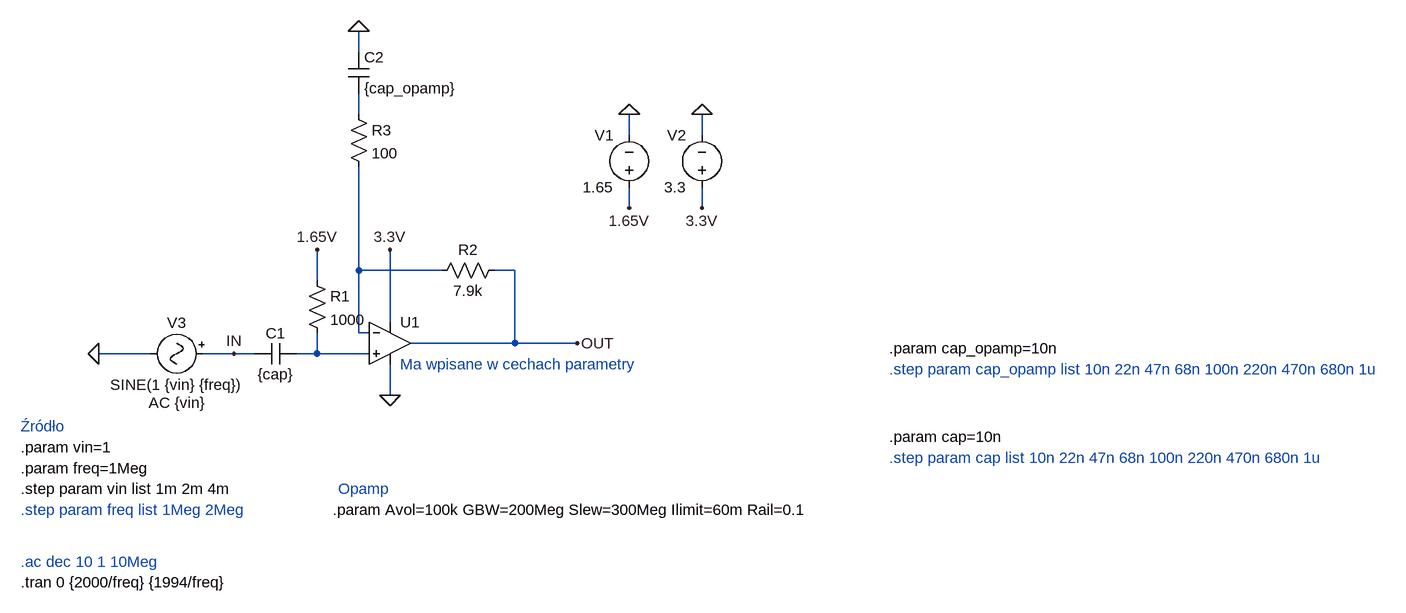
[diagram p0: schematic wzm_wej.asc]
wzm_wej.asc, the LTspice schematic file:
Version 4.1
SHEET 1 1884 680
WIRE 240 -304 240 -336
WIRE 240 -208 240 -240
WIRE 656 -176 656 -208
WIRE 768 -176 768 -208
WIRE 656 -64 656 -96
WIRE 768 -64 768 -96
WIRE 240 32 240 -128
WIRE 368 32 240 32
WIRE 480 32 448 32
WIRE 176 48 176 0
WIRE 288 112 288 0
WIRE 240 128 240 32
WIRE 256 128 240 128
WIRE 480 144 480 32
WIRE 480 144 320 144
WIRE 576 144 480 144
WIRE -80 160 -160 160
WIRE 48 160 0 160
WIRE 80 160 48 160
WIRE 176 160 176 128
WIRE 176 160 144 160
WIRE 256 160 176 160
WIRE 288 224 288 176
FLAG 656 -208 0
FLAG 768 -208 0
FLAG -160 160 0
FLAG 288 224 0
FLAG 240 -336 0
FLAG 576 144 OUT
FLAG 656 -64 1.65V
FLAG 176 0 1.65V
FLAG 768 -64 3.3V
FLAG 288 0 3.3V
FLAG 48 160 IN
SYMBOL cap 144 144 R90
WINDOW 0 0 32 VBottom 2
WINDOW 3 32 32 VTop 2
SYMATTR InstName C1
SYMATTR Value {cap}
SYMBOL res 160 32 R0
SYMATTR InstName R1
SYMATTR Value 1000
SYMBOL voltage 656 -80 R180
WINDOW 0 24 96 Left 2
WINDOW 3 24 16 Left 2
WINDOW 123 0 0 Left 0
WINDOW 39 0 0 Left 0
SYMATTR InstName V1
SYMATTR Value 1.65
SYMBOL voltage 768 -80 R180
WINDOW 0 24 96 Left 2
WINDOW 3 24 16 Left 2
WINDOW 123 0 0 Left 0
WINDOW 39 0 0 Left 0
SYMATTR InstName V2
SYMATTR Value 3.3
SYMBOL Misc\\signal 16 160 R90
WINDOW 0 -32 56 VBottom 2
WINDOW 3 32 56 VTop 2
WINDOW 123 60 56 VTop 2
WINDOW 39 0 0 Left 0
SYMATTR InstName V3
SYMATTR Value SINE(1 {vin} {freq})
SYMATTR Value2 AC {vin}
SYMBOL res 464 16 R90
WINDOW 0 0 56 VBottom 2
WINDOW 3 32 56 VTop 2
SYMATTR InstName R2
SYMATTR Value 7.9k
SYMBOL res 224 -224 R0
SYMATTR InstName R3
SYMATTR Value 100
SYMBOL cap 224 -304 R0
SYMATTR InstName C2
SYMATTR Value {cap_opamp}
SYMBOL OpAmps\\UniversalOpAmp2 288 144 R0
SYMATTR InstName U1
SYMATTR Value2 Avol={Avol} GBW={GBW} Slew={Slew}
SYMATTR SpiceLine Ilimit={Ilimit} Rail={Rail} Vos=0
TEXT -280 368 Left 2 !.step param vin list 1m 2m 4m
TEXT -280 400 Left 2 ;.step param freq list 1Meg 2Meg
TEXT -280 480 Left 2 ;.ac dec 10 1 10Meg
TEXT -280 512 Left 2 !.tran 0 {2000/freq} {1994/freq}
TEXT 200 400 Left 2 !.param Avol=100k GBW=200Meg Slew=300Meg Ilimit=60m Rail=0.1
TEXT -280 272 Left 2 ;Źródło
TEXT 208 368 Left 2 ;Opamp
TEXT -280 304 Left 2 !.param vin=1
TEXT -280 336 Left 2 !.param freq=1Meg
TEXT 304 176 Left 2 ;Ma wpisane w cechach parametry
TEXT 1056 288 Left 2 !.param cap=10n
TEXT 1056 320 Left 2 ;.step param cap list 10n 22n 47n 68n 100n 220n 470n 680n 1u
TEXT 1056 152 Left 2 !.param cap_opamp=10n
TEXT 1056 184 Left 2 ;.step param cap_opamp list 10n 22n 47n 68n 100n 220n 470n 680n 1u

The netlist it stands for:
* wzm_wej.asc
C1 N003 IN {cap}
R1 1.65V N003 1000
V1 1.65V 0 1.65
V2 3.3V 0 3.3
V3 IN 0 SINE(1 {vin} {freq}) AC {vin}
R2 OUT N002 7.9k
R3 N001 N002 100
C2 0 N001 {cap_opamp}
X§U1 N003 N002 3.3V 0 OUT level2 Avol={Avol} GBW={GBW} Slew={Slew} Ilimit={Ilimit} Rail={Rail} Vos=0 En=0 Enk=0 In=0 Ink=0 Rin=500Meg  ; pins In+ In- V+ V- OUT
.step param vin list 1m 2m 4m
* .step param freq list 1Meg 2Meg
* .ac dec 10 1 10Meg
.tran 0 {2000/freq} {1994/freq}
.param Avol=100k GBW=200Meg Slew=300Meg Ilimit=60m Rail=0.1
* Źródło
* Opamp
.param vin=1
.param freq=1Meg
* Ma wpisane w cechach parametry
.param cap=10n
* .step param cap list 10n 22n 47n 68n 100n 220n 470n 680n 1u
.param cap_opamp=10n
* .step param cap_opamp list 10n 22n 47n 68n 100n 220n 470n 680n 1u
.lib UniversalOpAmp2.lib
.backanno
.end